# Altium schematic sheet DebugBoardPowerControl.SchDoc
size 420 x 297 mm; SheetNumber: 3; SheetTotal: 6
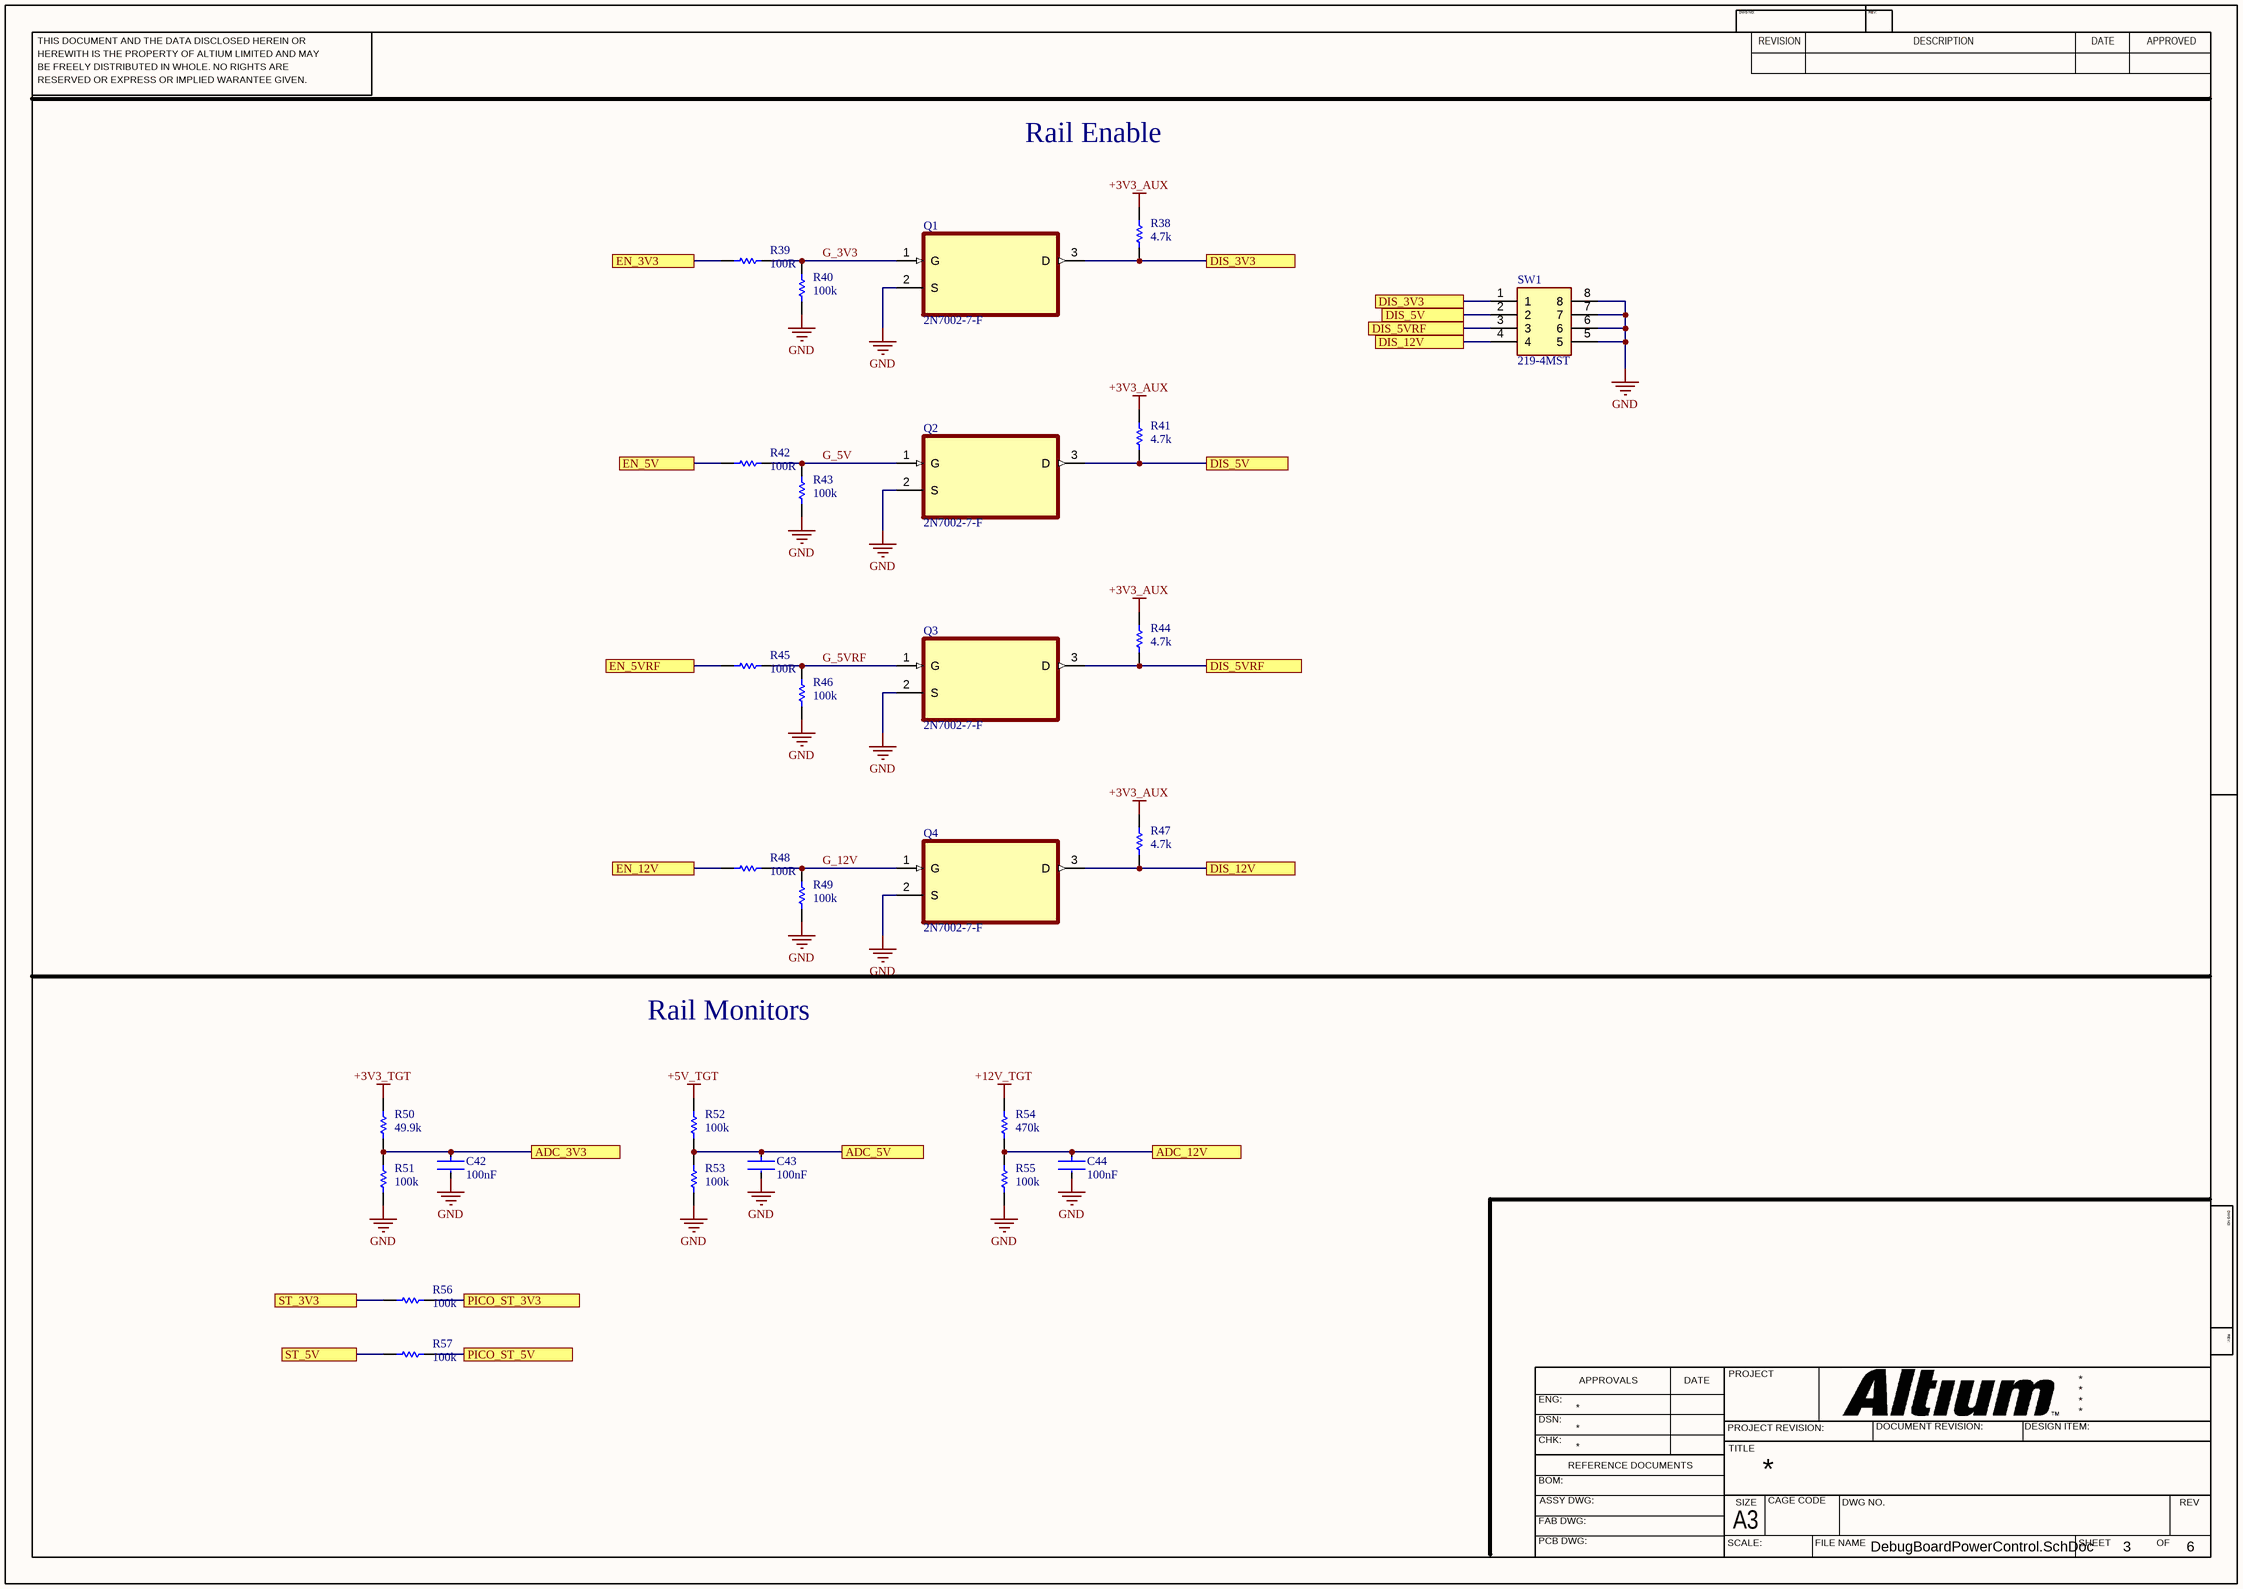
[diagram p0: DebugBoardPowerControl.SchDoc]

## Parts
C42  100nF  [FP-C0805C-DN-MFG]
C43  100nF  [FP-C0805C-DN-MFG]
C44  100nF  [FP-C0805C-DN-MFG]
Q1  2N7002-7-F  [SOT103P240X110-3N]
Q2  2N7002-7-F  [SOT103P240X110-3N]
Q3  2N7002-7-F  [SOT103P240X110-3N]
Q4  2N7002-7-F  [SOT103P240X110-3N]
R38  4.7k  [RES_0805]
R39  100R  [RES_0805]
R40  100k  [RES_0805]
R41  4.7k  [RES_0805]
R42  100R  [RES_0805]
R43  100k  [RES_0805]
R44  4.7k  [RES_0805]
R45  100R  [RES_0805]
R46  100k  [RES_0805]
R47  4.7k  [RES_0805]
R48  100R  [RES_0805]
R49  100k  [RES_0805]
R50  49.9k  [RES_0805]
R51  100k  [RES_0805]
R52  100k  [RES_0805]
R53  100k  [RES_0805]
R54  470k  [RES_0805]
R55  100k  [RES_0805]
R56  100k  [RES_0805]
R57  100k  [RES_0805]
SW1  219-4MST  [2194MST]

## Ports
ADC_3V3, ADC_5V, ADC_12V, DIS_3V3, DIS_5V, DIS_5VRF, DIS_12V, EN_3V3, EN_5V, EN_5VRF, EN_12V, PICO_ST_3V3, PICO_ST_5V, ST_3V3, ST_5V

## Nets
+3V3_AUX: R38.2 R41.2 R44.2 R47.2
+3V3_TGT: R50.1
+5V_TGT: R52.1
+12V_TGT: R54.1
GND: C42.2 C43.2 C44.2 Q1.2(S) Q2.2(S) Q3.2(S) Q4.2(S) R40.2 R43.2 R46.2 R49.2 R51.2 R53.2 R55.2 SW1.5 SW1.6 SW1.7 SW1.8
ADC_3V3: C42.1 R50.2 R51.1 ; port ADC_3V3
ADC_5V: C43.1 R52.2 R53.1 ; port ADC_5V
ADC_12V: C44.1 R54.2 R55.1 ; port ADC_12V
DIS_3V3: Q1.3(D) R38.1 SW1.1 ; port DIS_3V3
DIS_5V: Q2.3(D) R41.1 SW1.2 ; port DIS_5V
DIS_5VRF: Q3.3(D) R44.1 SW1.3 ; port DIS_5VRF
DIS_12V: Q4.3(D) R47.1 SW1.4 ; port DIS_12V
EN_3V3: R39.1 ; port EN_3V3
EN_5V: R42.1 ; port EN_5V
EN_5VRF: R45.1 ; port EN_5VRF
EN_12V: R48.1 ; port EN_12V
G_3V3: Q1.1(G) R39.2 R40.1
G_5V: Q2.1(G) R42.2 R43.1
G_5VRF: Q3.1(G) R45.2 R46.1
G_12V: Q4.1(G) R48.2 R49.1
PICO_ST_3V3: R56.2 ; port PICO_ST_3V3
PICO_ST_5V: R57.2 ; port PICO_ST_5V
ST_3V3: R56.1 ; port ST_3V3
ST_5V: R57.1 ; port ST_5V

## Notes on the sheet
- Rail Enable
- Rail Monitors
- THIS DOCUMENT AND THE DATA DISCLOSED HEREIN OR
- HEREWITH IS THE PROPERTY OF ALTIUM LIMITED AND MAY
- DWG NO:
- REVISION
- REV:
- DESCRIPTION
- DATE
- APPROVED
- BE FREELY DISTRIBUTED IN WHOLE. NO RIGHTS ARE
- RESERVED OR EXPRESS OR IMPLIED WARANTEE GIVEN.
- ENG:
- APPROVALS
- PROJECT
- DSN:
- CHK:
- REFERENCE DOCUMENTS
- PROJECT REVISION:
- TITLE
- DOCUMENT REVISION:
- DESIGN ITEM:
- BOM:
- FAB DWG:
- PCB DWG:
- ASSY DWG:
- SCALE:
- A3
- SIZE
- CAGE CODE
- FILE NAME
- DWG NO.
- SHEET
- OF
- REV

## Library data of the parts
C42-C44 = CMP-03020-000950-1: CAP CER 0.1UF 50V X7R 0805; Manufacturer: KEMET; Manufacturer Part Number: C0805C104J5RACTU; Temperature Coefficient: 30ppm/°C; Value: 0.10 μF; Material: Ceramic; Tolerance: 0.05; Voltage Rating: 50 V; Digikey Description: CAP CER 0.1UF 50V X7R 0805; Octopart: https://octopart.com/c0805c104j5ractu-kemet-104634; RoHS: TRUE; Device Class L1: Passive Components; Temperature Characteristic: X7R; Device Class L3: Ceramic Capacitors; Lead Free: Yes; Automotive: No; Category: Cap; Temperature: -55°C to +125°C; Package: C0805C-DN; Temperature Range High: +125°C; Height: 0.88mm; Capacitance: 0.10 μF; Temperature Range Low: -55°C; ComponentLink2Description: Datasheet; ComponentLink2URL: https://content.kemet.com/datasheets/KEM_C1003_C0G_SMD.pdf; Ipc Land Pattern Name: CAPC200125X78; Device Class L2: Capacitors; Mouser Description: Multilayer Ceramic Capacitors MLCC - SMD/SMT 50volts 0.1uF X7R 5%
Q1-Q4 = 2N7002-7-F: N-Channel 60 V 115mA (Ta) 370mW (Ta) Surface Mount SOT-23-3; MF: Diodes Inc.; Purchase-URL: https://pricing.snapeda.com/search/part/2N7002-7-F/?ref=eda; Package: SOT-23-3 Diodes Inc.; MP: 2N7002-7-F; Price: None; Availability: In Stock; Value: 2N7002-7-F; Check_prices: https://www.snapeda.com/parts/2N7002-7-F/Diodes+Inc./view-part/?ref=eda; SnapEDA_Link: https://www.snapeda.com/parts/2N7002-7-F/Diodes+Inc./view-part/?ref=snap
R38-R57 = CMP-009-00183-1: Resistor SMD 0805 - Generic; Source: Generic_Schematic_Library.SchLib; Design Item ID: RES_0805
SW1 = 219-4MST: DIP Switches / SIP Switches; Manufacturer_Name: CTS; Geometry.Height: 4.3mm; Manufacturer_Part_Number: 219-4MST; Mouser Part Number: 774-2194MST; Mouser Price/Stock: https://www.mouser.co.uk/ProductDetail/CTS-Electronic-Components/219-4MST?qs=qNzHFtQhdJ8xGV2Z9mul9A%3D%3D; Arrow Part Number: 219-4MST; Arrow Price/Stock: https://www.arrow.com/en/products/219-4mst/cts; Datasheet Link: https://componentsearchengine.com/Datasheets/1/219-4MST.pdf